# Altium project Lipo_discharger_new.PrjPcb
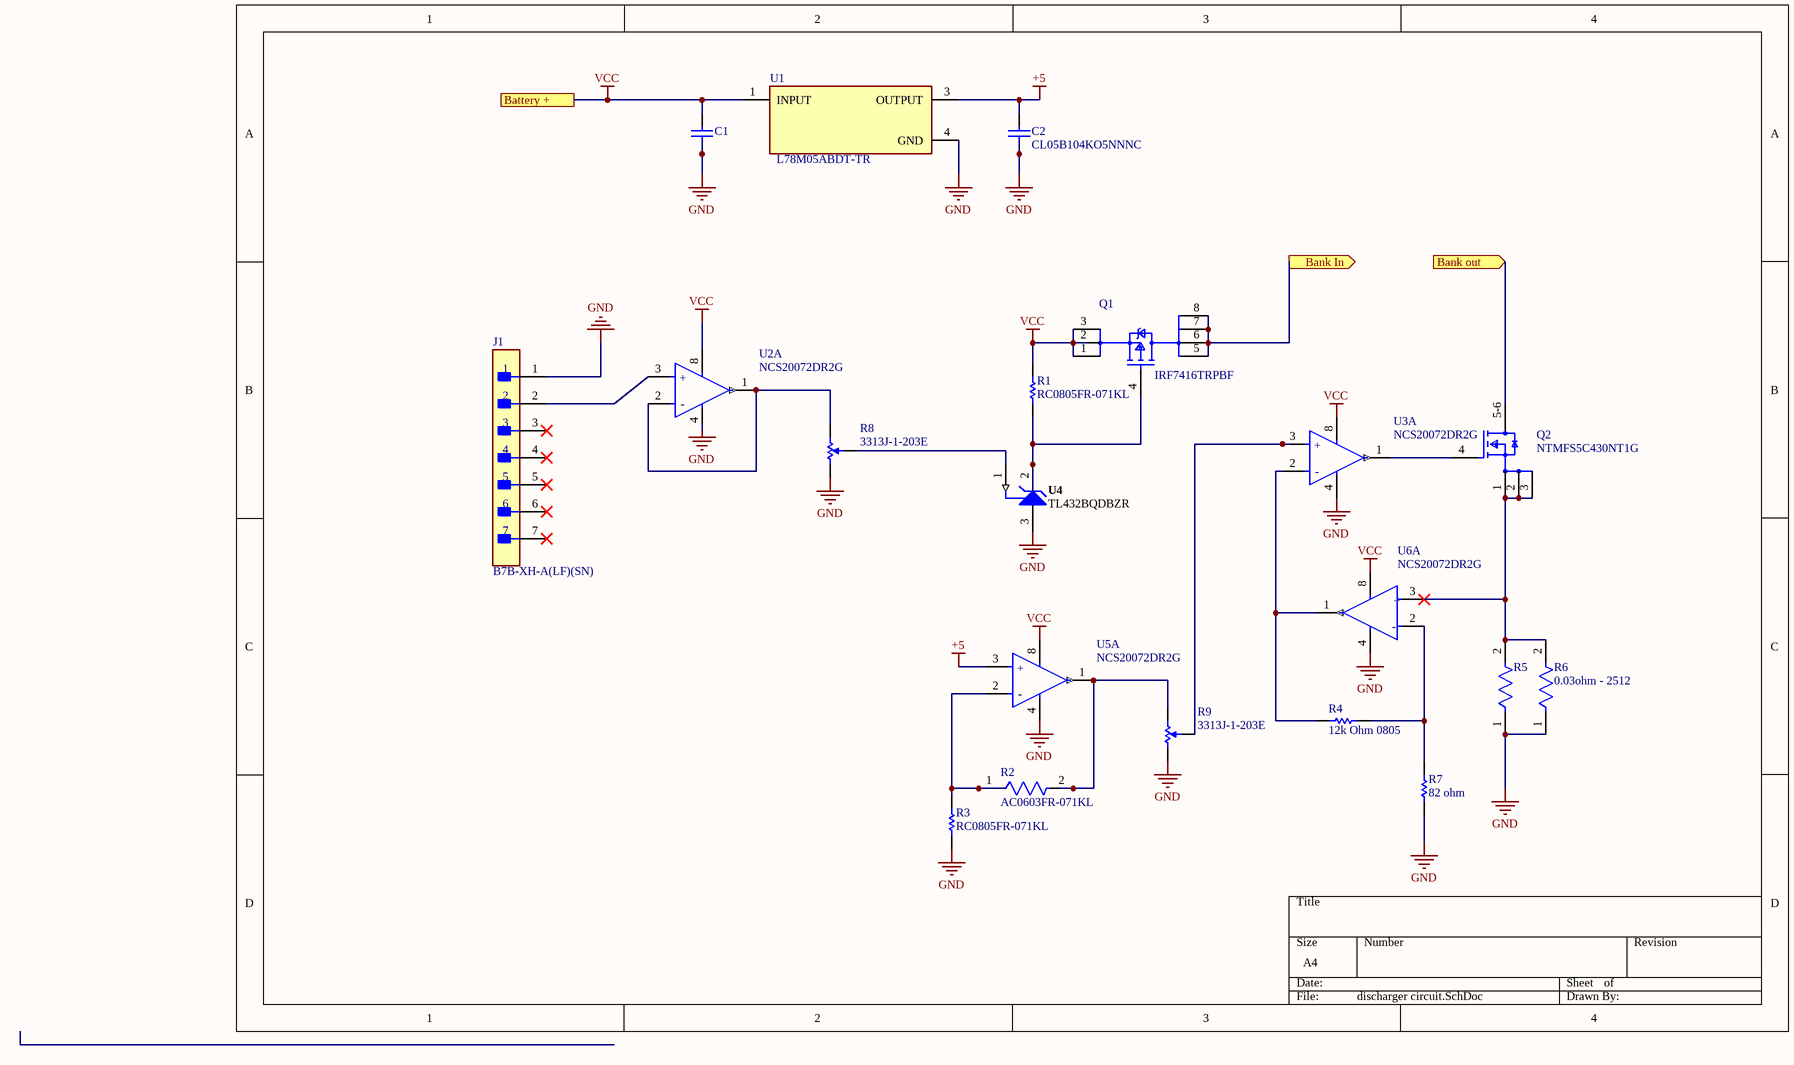
[diagram p0: discharger circuit.SchDoc]
1 sheet, 20 parts. Net scope: flat (ports and power ports of the same name join across sheets).
Board files: Drain_board.PcbDoc, Array.PcbDoc

## Sheet discharger circuit.SchDoc
size A4; SheetNumber: 1; SheetTotal: 1

### Parts
C1  C0805C225K9PACTU  [CAPC2013X145X50ML20T25]  (value not drawn)
C2  CL05B104KO5NNNC  [CAPC1050X55X23ML05T13]
J1  B7B-XH-A(LF)(SN)  [FP-B7B-XH-A_LF_SN-MFG]
Q1  IRF7416TRPBF  [FP-PG-DSO-8-IPC_B]
Q2  NTMFS5C430NT1G  [FP-488AA-MFG]
R1  RC0805FR-071KL  [RESC2013X60X35ML10T20]
R2  AC0603FR-071KL  [FP-AC0603-IPC_B]
R3  RC0805FR-071KL  [RESC2013X60X35ML10T20]
R4  12k Ohm 0805  [RESC2013X50X30NL20T20]
R5  0.03ohm - 2512  [FP-CRCW2512-e3-MFG]  (value not drawn)
R6  0.03ohm - 2512  [FP-CRCW2512-e3-MFG]
R7  82 ohm  [RESC1005X40X25LL05T05]
R8  3313J-1-203E  [BOUR-3313J-1_V]
R9  3313J-1-203E  [BOUR-3313J-1_V]
U1  L78M05ABDT-TR  [FP-L78M05ABDT-TR-MFG]
U2  NCS20072DR2G  [FP-751-07-MFG]  (part A of 2)
U3  NCS20072DR2G  [FP-751-07-MFG]  (part A of 2)
U4  TL432BQDBZR  [DBZ0003A_N]
U5  NCS20072DR2G  [FP-751-07-MFG]  (part A of 2)
U6  NCS20072DR2G  [FP-751-07-MFG]  (part A of 2)

### Ports
Bank In (out), Bank out (in), Battery +

### Nets
+5: C2.2 U1.3(OUTPUT) U5.3(IN+_1)
GND: C1.1 C2.1 J1.1 R3.1 R5.1 R6.1 R7.1 R8.1 R9.1 U1.4(GND) U2.4(VSS) U3.4(VSS) U4.3(ANODE) U5.4(VSS) U6.4(VSS)
VCC: C1.2 Q1.1(S) Q1.2(S) Q1.3(S) R1.2 U1.1(INPUT) U2.8(VDD) U3.8(VDD) U5.8(VDD) U6.8(VDD) ; port Battery +
NetJ1_2: J1.2 U2.3(IN+_1)
NetQ1_4: Q1.4(G) R1.1 U4.2(CATHODE)
NetQ1_5: Q1.5(D) Q1.6(D) Q1.7(D) Q1.8(D) ; port Bank In
NetQ2_1: Q2.1(S) Q2.2(S) Q2.3(S) R5.2 R6.2 U6.3(IN+_1)
NetQ2_4: Q2.4(G) U3.1(OUT_1)
NetQ2_5-6: Q2.5-6(D) ; port Bank out
NetR2_1: R2.1 R3.2 U5.2(IN-_1)
NetR2_2: R2.2 R9.3 U5.1(OUT_1)
NetR4_1: R4.1 U3.2(IN-_1) U6.1(OUT_1)
NetR4_2: R4.2 R7.2 U6.2(IN-_1)
NetR8_2: R8.2 U4.1(REF)
NetR8_3: R8.3 U2.1(OUT_1) U2.2(IN-_1)
NetR9_2: R9.2 U3.3(IN+_1)

Not connected (* = marked no-connect by the designer): J1 3* 4* 5* 6* 7*

### Notes on the sheet
- (in symbol CMP-07106-000003-1, part A) +; -

### Library data of the parts
C1 = CMP-1036-04819-2: Manufacturer: Kemet; Part Number: C0805C225K9PACTU
C2 = CMP-2000-05439-1: Chip Capacitor, 100 nF, +/- 10%, 16 V, -55 to 125 degC, 0402 (1005 Metric), RoHS, Tape and Reel; Manufacturer: Samsung Electro-Mechanics; Capacitance: 100000pF; Dielectric: X7R; Rated Voltage: 16V; Case Size/Dimension: 0402; Tolerance (%): ±10%; Manufacturer URL: http://www.samsungsem.com/global/index.jsp; Datasheet URL: https://datasheet.ciiva.com/29198/458718-da-01-en-vs-kondensator-0402-29198423.pdf; Datasheet Version: Nov-10
J1 = CMP-17439-000323-2: CONN HEADER VERT 7POS 2.5MM; Current Rating: 3A; Voltage Rating: 250V; Number of Contacts: 7; Mated Stacking Heights: 9.8mm; Insulation Resistance: 1GR; Contact Resistance: 20mR; Wire/Cable Gauge: 22AWG; Contact Finish - Mating: TIN; Orientation: Straight; REACH SVHC: No SVHC; Max Operating Temperature: 85°C; Housing Color: White; Pitch: 2.5mm; Mount: Through Hole; Packaging: Bulk; Depth: 5.75mm; Series: XH; Min Operating Temperature: -25°C; Length: 19.9mm; Connector Type: Header; Number of Positions: 7; Color: Natural; Max Current Rating: 3A; Lead Pitch: 2.5mm; Termination: Solder; Fastening Type: Detent; Flammability Rating: UL94 V-0; Voltage Rating (AC): 250V; Lead Free: Lead Free; Contact Material: Brass; Max Voltage Rating (AC): 250V; Contact Type: Male Pin; Housing Material: Polyamide; Insulation Color: Natural; Contact Shape: Square; Number of Rows: 1; Contact Plating: Tin; Insulation Material: Nylon
Q1 = CMP-32901-000322-1: MOSFET P-CH 30V 10A 8-SOIC; Max Dual Supply Voltage: -30V; Input Capacitance: 1.7nF; Max Power Dissipation: 2.5W; Turn-Off Delay Time: 59ns; Threshold Voltage: -20V; Rise Time: 49ns; Drain to Source Resistance: 35mR; Rds On Max: 20mR; Turn-On Delay Time: 18ns; Gate to Source Voltage (Vgs): 20V; Continuous Drain Current (ID): 10A; Length: 0.196inch; Packaging: Tape and Reel; Max Operating Temperature: 150°C; Case/Package: SO; Drain to Source Breakdown Voltage: -30V; Halogen Free: Halogen Free; Mount: Surface Mount; Contact Plating: Tin; Number of Pins: 8; Height: 0.059inch; Lead Free: Lead Free; Min Operating Temperature: -55°C; REACH SVHC: No SVHC; Width: 0.157inch; Power Dissipation: 2.5W; Drain to Source Voltage (Vdss): -30V; RoHS Compliant: Yes
Q2 = CMP-00278-75099839-1: NTMFS5C430NT1G T6-D3F 40V Nfet/Reel Rohs Compliant: Yes; Manufacturer Lifecycle Status: ACTIVE; Drain to Source Resistance: 1.4mΩ; RoHS: Compliant; Lead Free: Lead Free; Schedule B: 8541290080, 8541290080; NexarPartId: 75099839; Lifecycle Status: Production
R1 R3 = CMP-2100-03671-1: Chip Resistor, 1 KOhm, +/- 1%, 125 mW, -55 to 155 degC, 0805 (2012 Metric), RoHS, Tape and Reel; Manufacturer: Yageo; Temperature Coefficient: 100ppm/degreesC; Voltage Rating (DC): 150V; Max Power Dissipation: 125mW; Resistance: 1KOhm; Number of Pins: 2; Number of Terminations: 2; Datasheet URL: http://www.yageo.com/NewPortal/yageodocoutput?fileName=/pdf/R-Chip/PYu-RC_Group_51_RoHS_L_5.pdf; Length: 0.079inch; Package Description: 2-Pin Surface Mounted Device, Body 2 x 1.25 mm; Depth: 1.25mm; Height: 0.024inch; Military Standard: Not; Case/Package: 0805; Package Reference: 0805; RoHSCompliant: true; Lead Free: LeadFree; Packaging: TapeandReel; Package Quantity: 1; Datasheet Version: Rev. 5, 10/2016; Tolerance: 1%; Min Operating Temperature: -55degC; Voltage Rating: 150V; Composition: ThickFilm; Case Code (Imperial): 0805; Power Rating: 125mW; Width: 0.049inch; Case Code (Metric): 2012; Manufacturer URL: http://www.yageo.com/; Max Operating Temperature: 155degC; REACH SVHC: Unknown; Termination: SMD/SMT
R2 = CMP-2000-04828-3: RES 1kΩ 1.00% 0.1W 0603; Voltage Rating: 50V; Power Rating: 100mW; Tolerance: 1%; Temperature Coefficient: 100ppm/°C; Resistance: 1kR; Depth: 0.8mm; Case/Package: 0603; Size Code: 0603; Case Code (Metric): 1608; Height: 0.022inch; Series: AC; Width: 0.031inch; Construction: Rectangular; Length: 0.063inch; Case Code (Imperial): 0603; Package Quantity: 1; RoHS Compliant: Yes; Features: Moisture Resistant; Resistor Type: Thick Film; Max Power Dissipation: 100mW; Packaging: Tape and Reel; Termination: SMD/SMT; Ratings: AEC-Q200; Max Operating Temperature: 155°C; Min Operating Temperature: -55°C; Military Standard: Not; Lead Free: Lead Free; Number of Terminations: 2
R4 = CMP-2001-03792-1: Manufacturer: Vishay Dale; Part Number: CRCW08052R00JNEA
R5 R6 = CMP-02407-004199-1: RES Thick Film, 100kΩ, 1%, 1W, 100ppm/°C, 2512; Voltage Rating: 500V; Resistance: 100kR; Case Code (Metric): 6432; Temperature Coefficient: 100ppm/°C; Weight: 0.001429oz; Radiation Hardening: No; Voltage Rating (DC): 500V; Case Code (Imperial): 2512; Length: 6.3mm; Number of Pins: 2; Military Standard: Not; Packaging: Tape and Reel; Contact Plating: Tin; Width: 3.15mm; Lead Free: Lead Free; Package Quantity: 2000; Composition: Thick Film; Termination: SMD/SMT; Number of Terminations: 2; Features: Automotive AEC-Q200; Max Power Dissipation: 1W; Case/Package: 2512; Min Operating Temperature: -55°C; Depth: 3.15mm; Max Operating Temperature: 155°C; Tolerance: 1%; Power Rating: 1W; Height: 0.6mm
R7 = CMP-2000-07451-1: Chip Resistor, 0 Ohm, 0.1 W, -55 to 155 degC, 0402 (1005 Metric), RoHS, Tape and Reel; Manufacturer: Panasonic; Voltage Rating (DC): 50V; Temperature Coefficient: 600ppm/��C; Max Power Dissipation: 100mW; Resistance: 0mOhm; Tolerance: 5%; Number of Terminations: 2; Mount: SurfaceMount; Height: 0.35mm; Packaging: TapeandReel; Contact Plating: Tin; Manufacturer URL: http://www.panasonic.com/; Composition: ThickFilm; Max Operating Temperature: 155degC; REACH SVHC: NoSVHC; Case/Package: 0402; Package Reference: 402; Depth: 0.5mm; Package Description: 2-Pin Surface Mount Device, Body 1 x 0.5 mm; Datasheet URL: https://industrial.panasonic.com/cdbs/www-data/pdf/RDA0000/AOA0000C301.pdf; RoHSCompliant: True; Case Code (Imperial): 0402; Military Standard: Not; Min Operating Temperature: -55degC; Power Rating: 100mW; Datasheet Version: 03/2015; Length: 1mm; Case Code (Metric): 1005; Termination: SMD/SMT; Mounting Technology: SurfaceMount; Voltage Rating: 50V; Width: 0.02inch; Package Quantity: 1; Lead Free: LeadFree; Radiation Hardening: No
R8 R9 = CMP-2000-05586-1: 3 mm Trimpot(R) Trimming Potentiometer, 20 KOhm, +/- 20%, 0.125 W, -55 to 125 degC, 3-Pin SMD, RoHS, Tape and Reel; Manufacturer: Bourns; Insulation Resistance: 100Megohms(Min.)@500VDC; Rotational Life: 100Cycles; Resolution: Infinite; Brand/Series: Trimpot®3313-SealedSeries; Temperature, Operating, Maximum: +125°C; Resistance: 20Kilohms; Resistance, Insulation: 100Megohms; Material, Element: Cermet; Standards: RoHSCompliant; Dielectric Strength: 500VAC; Load Life: 1000hr@0.125W,70°C; Torque: 50g-cm; Temperature Coefficient: ±100ppm/°C; Number of Turns: 1; Power, Rating: 0.125W; Angle, Mechanical: 250°; Temperature, Operating, Minimum: -55°C; Package Reference: 3313J-1; Dimensions: 0.126"Lx0.138"Wx0.087"H; Tolerance: ±20%; Type: Trimmer; Package Description: 3-Pin Surface Mount Device, Body 3.5 x 3.2 mm, Pitch 1.15 mm; Mounting Technology: SurfaceMount; Datasheet URL: http://www.bourns.com/docs/Product-Datasheets/3313.pdf; Mounting Type: SurfaceMount; Manufacturer URL: http://www.bourns.com/; Datasheet Version: 05/2016; Termination: SMD
U1 = CMP-0244-00177-2: IC REG LINEAR 5V 500MA DPAK; Polarity: Positive; Accuracy: 2%; Max Input Voltage: 35V; Tolerance: 4%; Power Supply Rejection Ratio (PSRR): 62dB; Dropout Voltage: 2V; Output Type: Fixed; Number of Regulators: 1; Min Input Voltage: 10V; Quiescent Current: 6mA; Mount: Surface Mount; Min Operating Temperature: -40°C; Lead Free: Lead Free; Number of Pins: 3; Height: 2.4mm; Weight: 0.01lb; Width: 6.2mm; Packaging: Tape and Reel; Output Current: 500mA; Output Voltage: 5V; Case/Package: TO-252; REACH SVHC: No SVHC; Max Operating Temperature: 125°C; Nominal Output Voltage: 5V; Number of Outputs: 1; Min Output Voltage: 5V; Radiation Hardening: No; Length: 6.6mm; Max Output Current: 500mA; Contact Plating: Tin; Output Voltage Accuracy: 2%; Package Quantity: 1
U2 U3 U5 U6 = CMP-07106-000003-1: IC OPAMP 3MHZ RRO DUAL 8SOIC; Manufacturer: ON Semiconductor; Standoff Height: 0.1mm; Voltage Gain: 118-120dB; Max Junction Temp: +150°C; Min Supply Voltage: 2.7V; Max Dual Supply Voltage: 18V; Output Current Per Channel: 465uA; Input Bias Current: 0.000005uA; Input Offset Voltage: 1.3mV; Min Dual Supply Voltage: 1.35V; Max Supply Voltage: 36V; Nominal Supply Current: 405-465uA; Number Of Channels: 2; Gain Bandwidth: 3MHz; Temperature: -40°C to +125°C; Temperature Range High: +125°C; Ambient Temperature Range Low: -40°C; Device Class L1: Integrated Circuits (ICs); ComponentLink2Description: Datasheet; Package: 751-07; Lead Free: Yes; ComponentLink2URL: http://www.onsemi.com/pub/Collateral/NCS20071-D.PDF; Mouser Description: Operational Amplifiers - Op Amps R2R DUAL AMPLIFIER; Manufacturer Part Number: NCS20072DR2G; Octopart: https://octopart.com/ncs20072dr2g-on+semiconductor-56676507; Automotive: No; Device Class L3: Amplifiers - Op Amps; Device Class L2: Linear ICs; Category: IC; Bandwidth: 3MHz; Footprint Url: http://www.onsemi.com/pub/Collateral/751-07.PDF; RoHS: TRUE; Temperature Range Low: -40°C; Ambient Temperature Range High: +125°C; Height: 1.75mm; Digikey Description: IC OPAMP 3MHZ RRO DUAL 8SOIC
U4 = CMP-0366-00802-2: Adjustable Precision Shunt Regulator, 34 ppm / degC, 100 mA, -40 to 125 degC, 3-pin SOT-23 (DBZ), Green (RoHS & no Sb/Br); Manufacturer: Texas Instruments; VO Adj(Max)(V): 36; VO Adj(Min)(V): 2.495; Iout/Iz(Max)(mA): 100; Temp Coeff(Typ)(ppm/ degree C): 34; SubFamily: Shunt Voltage Reference; Initial Accuracy @ 25/deg C(%): 0.5; Rating: Catalog; Temp Coeff(Max)(ppm/ degree C): 92; Min Iz for Regulation(uA): 600; Mounting Technology: Surface Mount; DatasheetVersion: SLVS543M; ComponentLink3URL: http://www.ti.com/litv/pdf/mpds108a; Code_JEDEC: TO-236; ComponentLink3Description: Package Specification; ComponentLink1URL: http://www.ti.com/; PartNumber: TL432BQDBZR; Eco-Plan: Green (RoHS & no Sb/Br); PackageReference: DBZ0003A; ComponentLink2URL: http://www.ti.com/general/docs/lit/getliterature.tsp?genericPartNumber=TL432B&fileType=pdf; ComponentLink1Description: Manufacturer URL; PackageDescription: 3-Pin Plastic Small Outline, Body 2.92 x 1.3 mm, Pitch 0.95 mm; PackageVersion: 4203227/B; ComponentLink2Description: Datasheet